# EAGLE design OpenEVSE_ESP32_LCD_v1.0.2 (EAGLE 9.6.2)
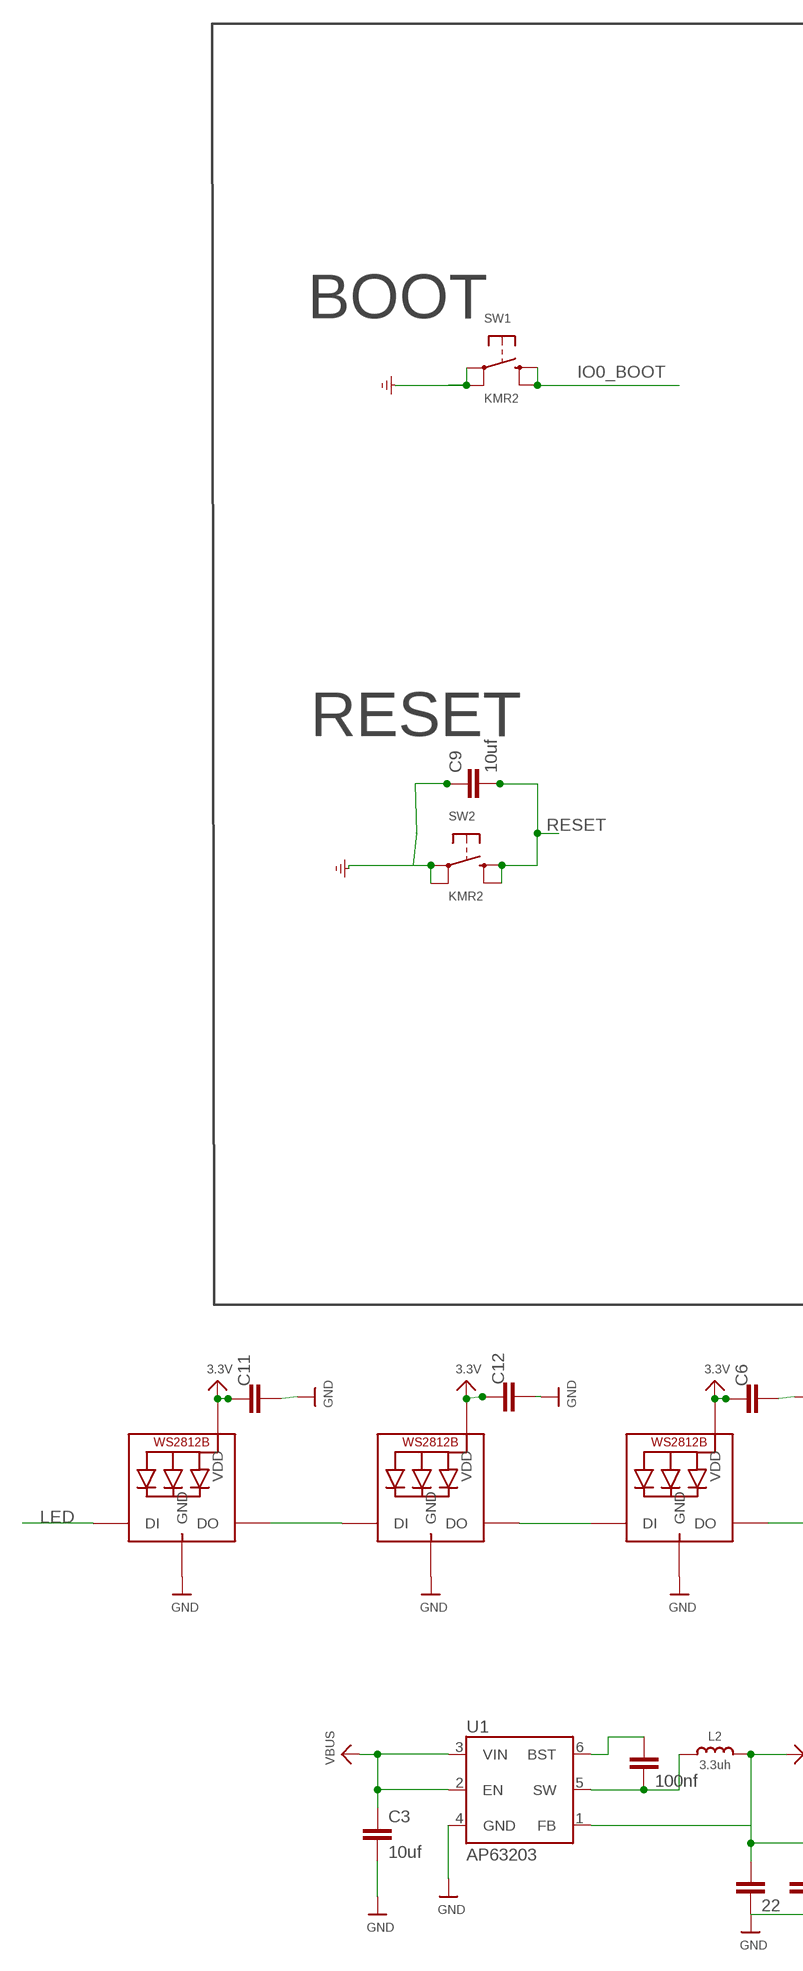
[diagram p0: schematic, sheet 1, part 1 of 2]
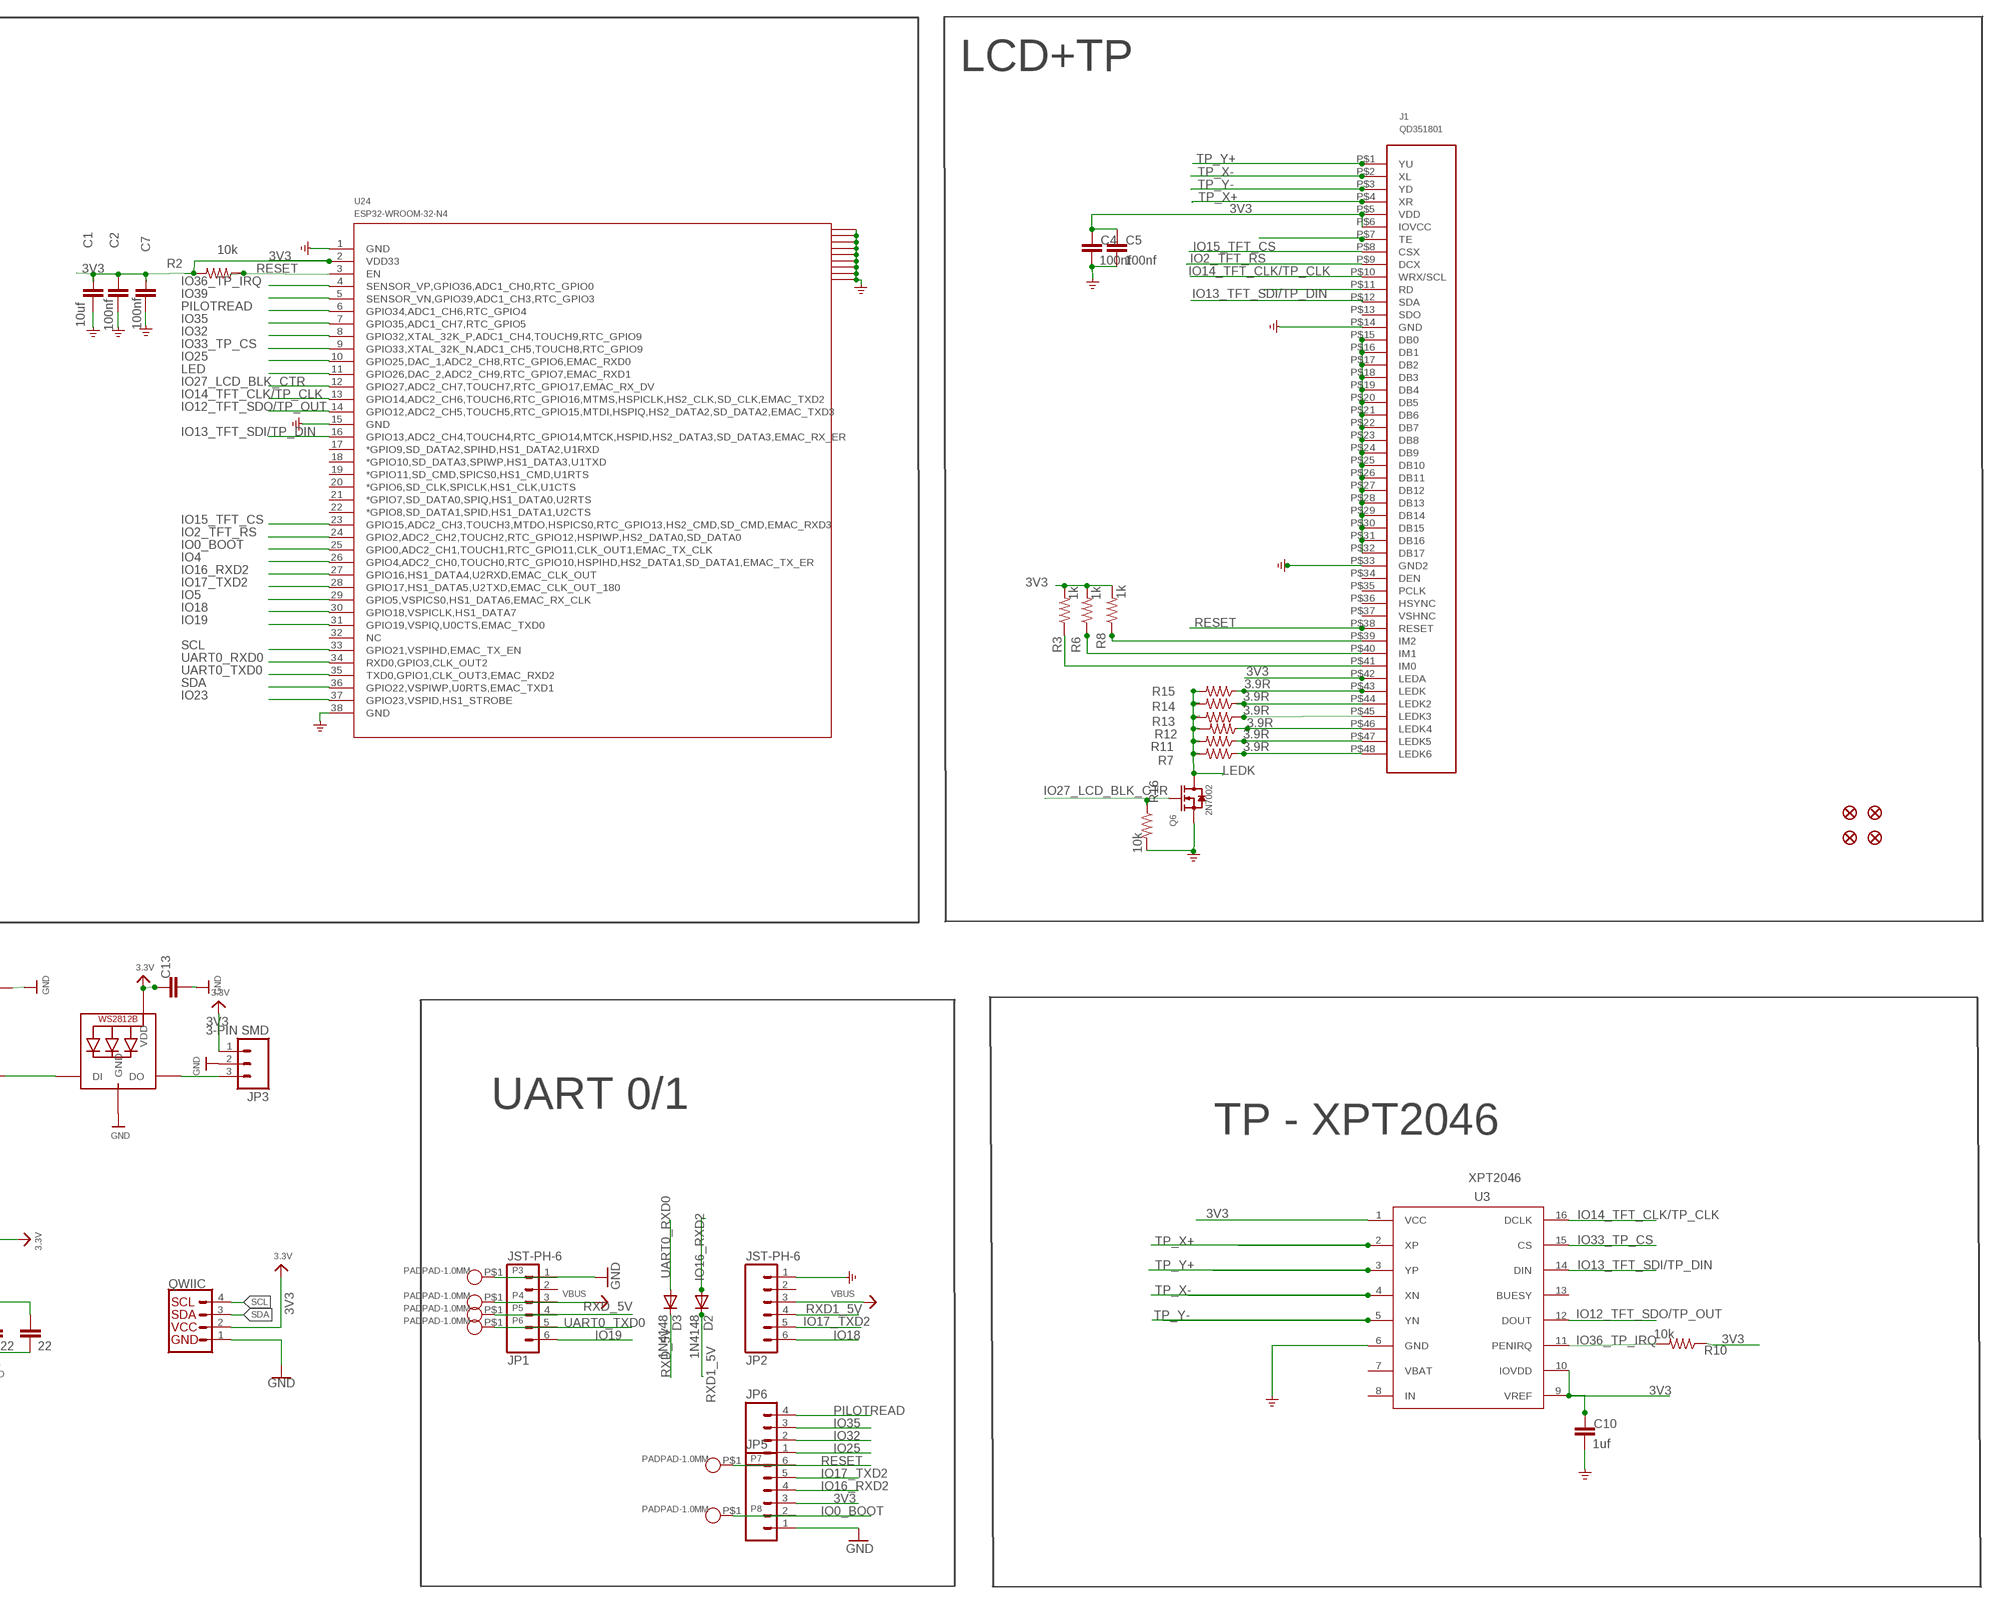
[diagram p1: schematic, sheet 1, part 2 of 2]

## Parts
C1  10uf  CAP0805  [0805]
C2  100nf  CAP0805  [0805]
C3  10uf  1.0UF-0805-25V-(+80/-20%)  [0805]
C4  100nf  CAP0805  [0805]
C5  100nf  CAP0805  [0805]
C6  CAP0805  [0805]
C7  100nf  CAP0805  [0805]
C8  22  1.0UF-0805-25V-(+80/-20%)  [0805]
C9  10uf  CAP0805  [0805]
C10  1uf  CAP0805  [0805]
C11  CAP0805  [0805]
C12  CAP0805  [0805]
C13  CAP0805  [0805]
C14  100nf  1.0UF-0805-25V-(+80/-20%)  [0805]
C15  22  1.0UF-0805-25V-(+80/-20%)  [0805]
D2  1N4148  DIODE-SOD123  [SOD123]
D3  1N4148  DIODE-SOD123  [SOD123]
FID1  FIDUCIAL1X2.5  [FIDUCIAL-1X2.5]
FID2  FIDUCIAL1X2.5  [FIDUCIAL-1X2.5]
FID3  FIDUCIAL1X2.5  [FIDUCIAL-1X2.5]
FID4  FIDUCIAL1X2.5  [FIDUCIAL-1X2.5]
J1  QD351801  [QD351801-0.8MM*48]
JP1  JST-PH-6  [JST-PH-6]
JP2  JST-PH-6  [JST-PH-6]
JP3  3-PIN SMD  M03JST-SMD  [JST-3-SMD]
JP5  M06SMD  [1X06-SMD]
JP6  M04SMD  [1X04-SMD]
L2  3.3uh  MICROBUILDER_INDUCTORNR5040  [MICROBUILDER_INDUCTOR_5X5MM_NR5040_NOTHERMALS]
LED1  WS2812B3535  [LED3535]
LED2  WS2812B3535  [LED3535]
LED3  WS2812B3535  [LED3535]
LED4  WS2812B3535  [LED3535]
P3  PADPAD-1.0MM  [PAD-1.0MM]
P4  PADPAD-1.0MM  [PAD-1.0MM]
P5  PADPAD-1.0MM  [PAD-1.0MM]
P6  PADPAD-1.0MM  [PAD-1.0MM]
P7  PADPAD-1.0MM  [PAD-1.0MM]
P8  PADPAD-1.0MM  [PAD-1.0MM]
Q6  2N7002  MOSFET-N'SOT23'  [SOT23]
QWIIC  QWIIC_CONNECTORJS-1MM  [JST04_1MM_RA]
R2  10k  RESISTOR0805  [0805]
R3  1k  RESISTOR0805  [0805]
R6  1k  RESISTOR0805  [0805]
R7  3.9R  RESISTOR0805  [0805]
R8  1k  RESISTOR0805  [0805]
R10  10k  RESISTOR0805  [0805]
R11  3.9R  RESISTOR0805  [0805]
R12  3.9R  RESISTOR0805  [0805]
R13  3.9R  RESISTOR0805  [0805]
R14  3.9R  RESISTOR0805  [0805]
R15  3.9R  RESISTOR0805  [0805]
R16  10k  RESISTOR0805  [0805]
SW1  KMR2  SWITCH_TACT_SMT4.6X2.8  [BTN_KMR2_4.6X2.8]
SW2  KMR2  SWITCH_TACT_SMT4.6X2.8  [BTN_KMR2_4.6X2.8]
U1  AP63203  [SOT23-6]
U3  XP2046  [XP2046-SSOP16]
U24  ESP32-WROOM-32-N4  [ESP32-WROOM-32-N4]

## Nets
3V3: C1.1 C2.1 C4.1 C5.1 C6.1 C7.1 C8.1 C10.1 C11.1 C12.1 C13.1 C15.1 J1.P$5(VDD) J1.P$6(IOVCC) J1.P$42(LEDA) JP3.1 JP5.3 L2.P$2 LED1.2(VDD) LED2.2(VDD) LED3.2(VDD) LED4.2(VDD) QWIIC.2 R2.2 R3.2 R6.2 R8.2 R10.1 U1.1(FB) U3.1(VCC) U3.9(VREF) U3.10(IOVDD) U24.2(VDD33) ; supply symbol labelled 3.3V
GND: C1.2 C2.2 C3.2 C4.2 C5.2 C6.2 C7.2 C8.2 C9.1 C10.2 C11.2 C12.2 C13.2 C15.2 J1.P$14(GND) J1.P$33(GND2) JP1.1 JP2.1 JP3.2 JP5.1 LED1.4(GND) LED2.4(GND) LED3.4(GND) LED4.4(GND) P3.P$1 Q6.2(S) QWIIC.1 R16.2 SW1.A'(P1) SW1.A(P) SW2.A'(P1) SW2.A(P) U1.4(GND) U3.6(GND) U24.1(GND) U24.15(GND) U24.38(GND) U24.41(GND) U24.42(GND) U24.43(GND) U24.44(GND) U24.45(GND) U24.46(GND) U24.47(GND) U24.48(GND) U24.49(GND)
IO0_BOOT: JP5.2 P8.P$1 SW1.B'(S1) SW1.B(S) U24.25(GPIO0,ADC2_CH1,TOUCH1,RTC_GPIO11,CLK_OUT1,EMAC_TX_CLK)
IO2_TFT_RS: J1.P$9(DCX) U24.24(GPIO2,ADC2_CH2,TOUCH2,RTC_GPIO12,HSPIWP,HS2_DATA0,SD_DATA0)
IO4: U24.26(GPIO4,ADC2_CH0,TOUCH0,RTC_GPIO10,HSPIHD,HS2_DATA1,SD_DATA1,EMAC_TX_ER)
IO5: U24.29(GPIO5,VSPICS0,HS1_DATA6,EMAC_RX_CLK)
IO12_TFT_SDO/TP_OUT: U3.12(DOUT) U24.14(GPIO12,ADC2_CH5,TOUCH5,RTC_GPIO15,MTDI,HSPIQ,HS2_DATA2,SD_DATA2,EMAC_TXD3)
IO13_TFT_SDI/TP_DIN: J1.P$12(SDA) U3.14(DIN) U24.16(GPIO13,ADC2_CH4,TOUCH4,RTC_GPIO14,MTCK,HSPID,HS2_DATA3,SD_DATA3,EMAC_RX_ER)
IO14_TFT_CLK/TP_CLK: J1.P$10(WRX/SCL) U3.16(DCLK) U24.13(GPIO14,ADC2_CH6,TOUCH6,RTC_GPIO16,MTMS,HSPICLK,HS2_CLK,SD_CLK,EMAC_TXD2)
IO15_TFT_CS: J1.P$8(CSX) U24.23(GPIO15,ADC2_CH3,TOUCH3,MTDO,HSPICS0,RTC_GPIO13,HS2_CMD,SD_CMD,EMAC_RXD3)
IO16_RXD2: D2.A JP5.4 U24.27(GPIO16,HS1_DATA4,U2RXD,EMAC_CLK_OUT)
IO17_TXD2: JP2.5 JP5.5 U24.28(GPIO17,HS1_DATA5,U2TXD,EMAC_CLK_OUT_180)
IO18: JP2.6 U24.30(GPIO18,VSPICLK,HS1_DATA7)
IO19: JP1.6 U24.31(GPIO19,VSPIQ,U0CTS,EMAC_TXD0)
IO23: U24.37(GPIO23,VSPID,HS1_STROBE)
IO25: JP6.1 U24.10(GPIO25,DAC_1,ADC2_CH8,RTC_GPIO6,EMAC_RXD0)
IO27_LCD_BLK_CTR: Q6.1(G) R16.1 U24.12(GPIO27,ADC2_CH7,TOUCH7,RTC_GPIO17,EMAC_RX_DV)
IO32: JP6.2 U24.8(GPIO32,XTAL_32K_P,ADC1_CH4,TOUCH9,RTC_GPIO9)
IO33_TP_CS: U3.15(CS) U24.9(GPIO33,XTAL_32K_N,ADC1_CH5,TOUCH8,RTC_GPIO9)
IO35: JP6.3 U24.7(GPIO35,ADC1_CH7,RTC_GPIO5)
IO36_TP_IRQ: R10.2 U3.11(PENIRQ) U24.4(SENSOR_VP,GPIO36,ADC1_CH0,RTC_GPIO0)
IO39: U24.5(SENSOR_VN,GPIO39,ADC1_CH3,RTC_GPIO3)
LED: LED1.1(DI) U24.11(GPIO26,DAC_2,ADC2_CH9,RTC_GPIO7,EMAC_RXD1)
LEDK: Q6.3(D) R7.2 R11.2 R12.2 R13.2 R14.2 R15.2
N$2: LED1.3(DO) LED2.1(DI)
N$5: J1.P$15(DB0) J1.P$16(DB1) J1.P$17(DB2) J1.P$18(DB3) J1.P$19(DB4) J1.P$20(DB5) J1.P$21(DB6) J1.P$22(DB7) J1.P$23(DB8) J1.P$24(DB9) J1.P$25(DB10) J1.P$26(DB11) J1.P$27(DB12) J1.P$28(DB13) J1.P$29(DB14) J1.P$30(DB15) J1.P$31(DB16) J1.P$32(DB17)
N$6: LED3.3(DO) LED4.1(DI)
N$7: C14.2 L2.P$1 U1.5(SW)
N$8: J1.P$44(LEDK2) R14.1
N$9: J1.P$11(RD)
N$11: LED2.3(DO) LED3.1(DI)
N$12: J1.P$43(LEDK) R15.1
N$13: JP3.3 LED4.3(DO)
N$14: J1.P$39(IM2) R8.1
N$16: J1.P$40(IM1) R6.1
N$17: J1.P$41(IM0) R3.1
N$18: J1.P$7(TE)
N$21: C14.1 U1.6(BST)
N$32: J1.P$45(LEDK3) R13.1
N$33: J1.P$46(LEDK4) R12.1
N$34: J1.P$47(LEDK5) R11.1
N$35: J1.P$48(LEDK6) R7.1
PILOTREAD: JP6.4 U24.6(GPIO34,ADC1_CH6,RTC_GPIO4)
RESET: C9.2 J1.P$38(RESET) JP5.6 P7.P$1 R2.1 SW2.B'(S1) SW2.B(S) U24.3(EN)
RXD1_5V: D2.C JP2.4
RXD_5V: D3.C JP1.4 P5.P$1
SCL: QWIIC.4 U24.33(GPIO21,VSPIHD,EMAC_TX_EN)
SDA: QWIIC.3 U24.36(GPIO22,VSPIWP,U0RTS,EMAC_TXD1)
TP_X+: J1.P$4(XR) U3.2(XP)
TP_X-: J1.P$2(XL) U3.4(XN)
TP_Y+: J1.P$1(YU) U3.3(YP)
TP_Y-: J1.P$3(YD) U3.5(YN)
UART0_RXD0: D3.A U24.34(RXD0,GPIO3,CLK_OUT2)
UART0_TXD0: JP1.5 P6.P$1 U24.35(TXD0,GPIO1,CLK_OUT3,EMAC_RXD2)
VBUS: C3.1 JP1.3 JP2.3 P4.P$1 U1.2(EN) U1.3(VIN)
Unconnected: J1.P$13(SDO) J1.P$34(DEN) J1.P$35(PCLK) J1.P$36(HSYNC) J1.P$37(VSHNC) JP1.2 JP2.2 U3.7(VBAT) U3.8(IN) U3.13(BUESY) U24.17(*GPIO9,SD_DATA2,SPIHD,HS1_DATA2,U1RXD) U24.18(*GPIO10,SD_DATA3,SPIWP,HS1_DATA3,U1TXD) U24.19(*GPIO11,SD_CMD,SPICS0,HS1_CMD,U1RTS) U24.20(*GPIO6,SD_CLK,SPICLK,HS1_CLK,U1CTS) U24.21(*GPIO7,SD_DATA0,SPIQ,HS1_DATA0,U2RTS) U24.22(*GPIO8,SD_DATA1,SPID,HS1_DATA1,U2CTS) U24.32(NC)

## Notes on the sheet
- LCD+TP
- BOOT
- RESET
- UART 0/1
- TP - XPT2046

## Library data of the parts
C1 C2 C4-C7 C9-C13 = SparkFun-Passives:CAP: Capacitor Standard 0603 ceramic capacitor, and 0.1" leaded capacitor.
C3 C8 C14 C15 = SparkFun-Capacitors:1.0UF: 1µF ceramic capacitors A capacitor is a passive two-terminal electrical component used to store electrical energy temporarily in an electric field.; PROD_ID: CAP-11625; VALUE: 1.0uF
D2 D3 = diode:DIODE-: DIODE
FID1-FID4 = SparkFun-Retired:FIDUCIAL: Fiducial Alignment Points Various fiducial points for machine vision alignment.
J1 = cooper:QD351801
JP1 JP2 = OpenEVSE:JST-PH-6
JP3 = SparkFun-Connectors:M03: Header 3 Standard 3-pin 0.1" header. Use with straight break away headers (SKU : PRT-00116), right angle break away headers (PRT-00553), swiss pins (PRT-00743), machine pins (PRT-00117), and female headers (PRT-00115). Molex polarized connector foot print use with SKU : PRT-08232 with associated crimp pins and housings.; PROD_ID: CONN-12591
JP5 = SparkFun:M06: Header 6 Standard 6-pin 0.1" header. Use with straight break away headers (SKU : PRT-00116), right angle break away headers (PRT-00553), swiss pins (PRT-00743), machine pins (PRT-00117), and female headers (PRT-00115). Molex polarized connector foot print use with SKU : PRT-08094 with associated crimp pins and housings. NOTES ON THE VARIANTS LOCK and LOCK_LONGPADS... This footprint was designed to help hold the alignment of a through-hole component (i.e. 6-pin header) while soldering it into place. You may notice that each hole has been shifted either up or down by 0.005 of an inch from it's more standard position (which is a perfectly straight line). This slight alteration caused the pins (the squares in the middle) to touch the edges of the holes. Because they are alternating, it causes a "brace" to hold the component in place. 0.005 has proven to be the perfect amount of "off-center" position when using our standard breakaway headers. Although looks a little odd when you look at the bare footprint, once you have a header in there, the alteration is very hard to notice. Also, if you push a header all the way into place, it is covered up entirely on the bottom side. This idea of altering the position of holes to aid alignment will be further integrated into the Sparkfun Library for other footprints. It can help hold any component with 3 or more connection pins.
JP6 = SparkFun:M04: Header 4 Standard 4-pin 0.1" header. Use with straight break away headers (SKU : PRT-00116), right angle break away headers (PRT-00553), swiss pins (PRT-00743), machine pins (PRT-00117), and female headers (PRT-00115). Molex polarized connector foot print use with SKU : PRT-08231 with associated crimp pins and housings. 1MM SMD Version SKU: PRT-10208
L2 = ESP32_v1_SMPS:MICROBUILDER_INDUCTOR: Inductors 0603: 10nH Ceramic Inductor - microwire antenna/RF (Digikey: 712-1434-2-ND) 0805: 560nH Ceramic Inductor - RF (Digikey: 553-1047-1-ND) 270nH Ceramic Inductor - Q = 40@250MHz, +-5%, 1 Ohm DC Resistance (Digikey: 535-10506-2-ND) 1007 (2518 Metric) SMT: 10µH 10% 250mOhm 820mA 1007 Inductor (Digikey: 587-2189-1-ND) 22µH 10% 500mOhm 580mA 1007 Inductor (Digikey: 587-2190-1-ND) 47µH 10% 950mOhm 420mA 1007 Inductor (Digikey: 587-2191-1-ND) 47µH 5% 100mOhm 1A 1008 Inductor (Digikey: 732-1816-1-ND) 5.0x5.0mm (Taiyo Yuden NR5040 Series) 6.8µH 20% 2.3A 64mOhm Inductor (Digikey: 587-2374-2-ND) 5.0x5.0mm (TDK VLC5045 Series) 4.7µH 20% 3.3A 34mOhm Inductor (Digikey: 445-6526-1-ND) 6.8µH 20% 2.7A 46mOhm Inductor (Digikey: 445-6527-1-ND) 6.0x6.0mm (TDK VLC6045 Series) 4.7µH 20% 3.8A 27mOhm Inductor (Digikey: 445-6538-2-ND) 6.8µH 20% 3A 41mOhm Inductor (Digikey: 445-6540-1-ND) 6.2µH 30% 2.2A 45mOhm Inductor (Digikey: SRR5028-6R2YCT-ND) - Not TDK VLC6045 but footprint should match 6.0x6.0mm (TDK SLF6045 Series) 6.8uH 30% 2A 33mOhm Inductor (Digikey: 445-4572-1-ND, Mouser: 810-SLF645T6R8N2R0PF) 6.0x6.0mm (Sumida CDRH5D28 Series) 6.2uH 30% 1.8A 45mOhm Inductor (Digikey: 308-1542-1-ND) Taiyo Yuden NR3015T2R2M - 2.2uH 20% 1.5A (Digikey: 587-1648-2-ND, Mouser: 963-NR3015T2R2M) - Used with TI TPS62172 CoilCraft RFID Transponder Coil - MA5532-AE (For use with AS3935 Lightning Sensor)
LED1-LED4 = adafruit:WS2812B
P3-P8 = crowpi_pow:PAD*
Q6 = discrete:MOSFET-N: IRLL014: http://www.vishay.com/docs/91319/sihll014.pdf
QWIIC = SparkFun-Connectors:QWIIC_CONNECTOR: SparkFun I2C Standard Qwiic Connector An SMD 1mm pitch JST connector makes it easy and quick (get it? Qwiic?) to connect I2C devices to each other. The Qwiic system <http://www.sparkfun.com/qwiic> enables fast and solderless connection between popular platforms and various sensors and actuators. We carry 200mm <https://www.sparkfun.com/products/14204>, 100mm <https://www.sparkfun.com/products/14205>, 50mm <https://www.sparkfun.com/products/14206>, and breadboard friendly <https://www.sparkfun.com/products/14207> Qwiic cables. We also offer 10 pcs strips <https://www.sparkfun.com/products/14323> the SMD connectors.; PROD_ID: CONN-13694
R2 R3 R6-R8 R10-R16 = SparkFun-Resistors:RESISTOR: Generic Resistor Package
SW1 SW2 = microbuilder:SWITCH_TACT_SMT: SMT Tact Switches 6x6mm - Digikey: P12940SCT-ND KMR2 (4.6x2.8mm) - Digikey: 401-1426-1-ND EVQ-PQHB55 - Light Touch, 160GF (4.5x4.5mm) - Digikey: P8090SCT-ND KMT0 - KMT021 NGJ LHS (etc.) IP68/Waterproof - Digikey: CKN10289CT-ND
U1 = SparkFun-IC-Power:AP63203: Diodes Inc. AP63203 3.8V-32V input 3.3V Buck The AP63200/AP63201/AP63203/AP63205 is a 2A, synchronous buck converter with a wide input voltage range of 3.8V to 32V and fully integrates a 125mΩ high-side power MOSFET and a 68mΩ lowside power MOSFET to provide high-efficiency step-down DC/DC conversion; PROD_ID: VREG-15244
U3 = cooper:XP2046; XPT2046: XPT2046
U24 = cooper:ESP32-WROOM-32-N4

## Net classes
0 default: width 0.152 mm, drill 0.3 mm, clearance 0.152 mm

## Board
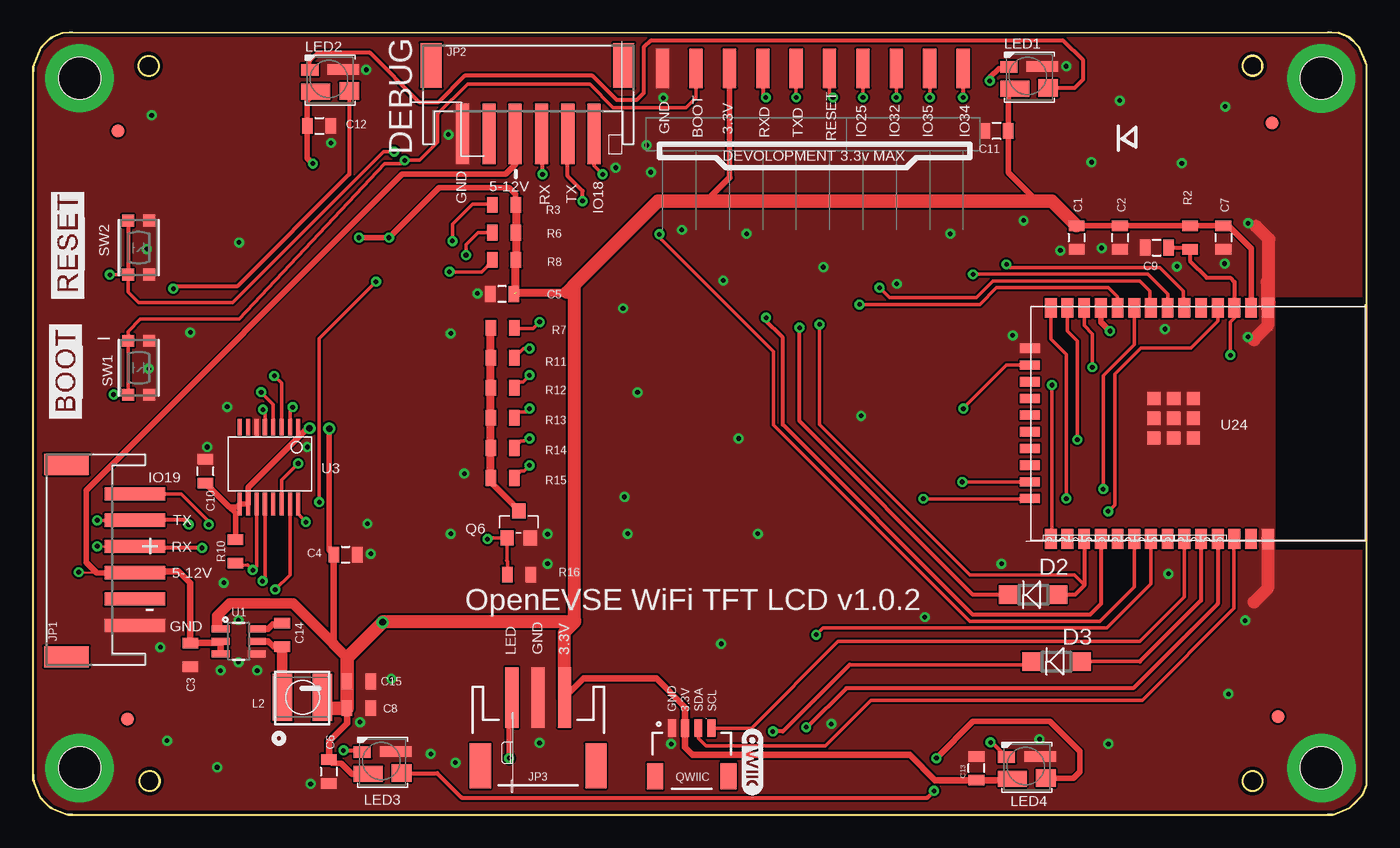
[diagram p2: board, top side]
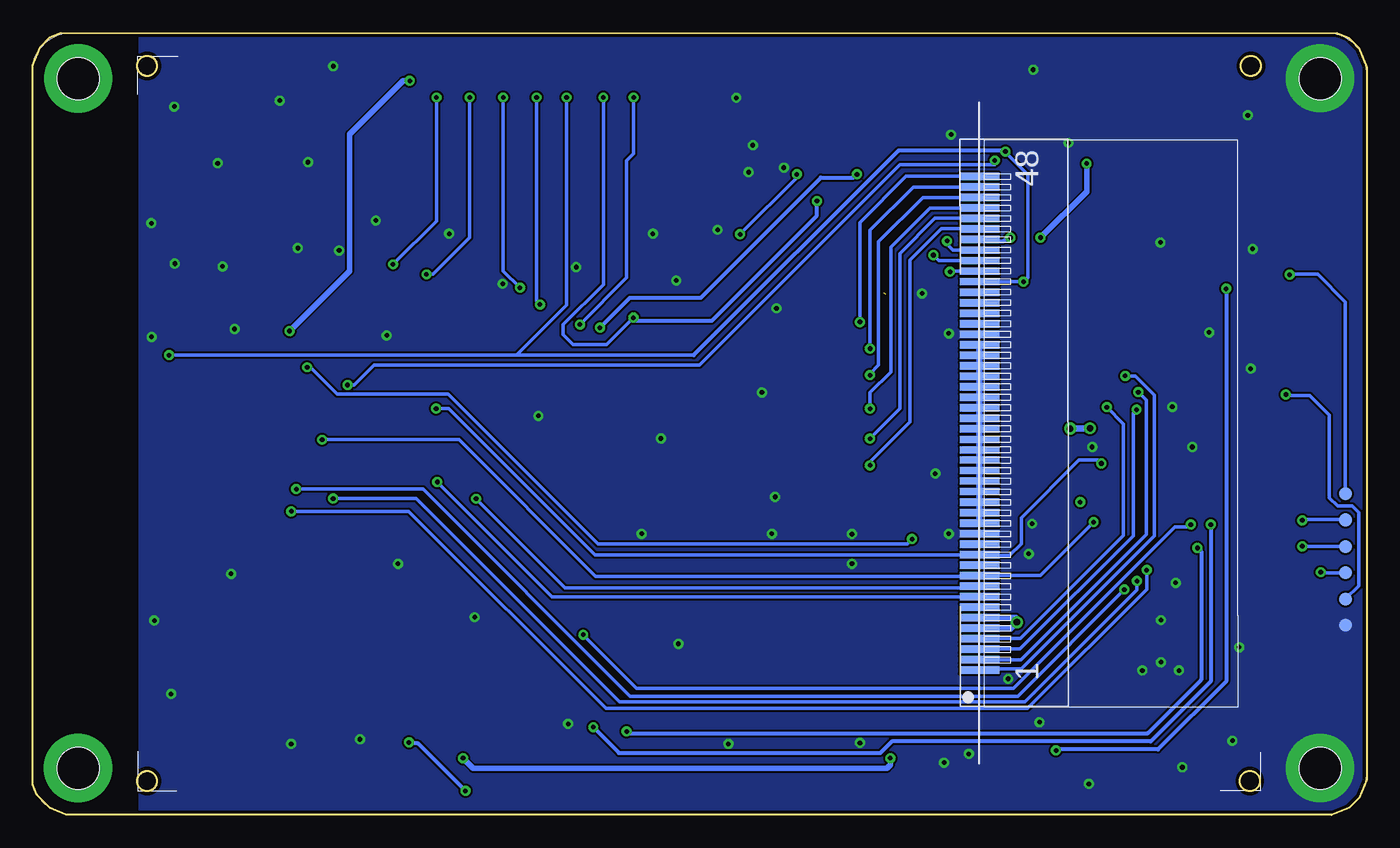
[diagram p3: board, bottom side, seen from below]

Size 101.5 x 59.52 mm. Coordinates in mm from the lower left corner, seen from the top.
Outline: 101.5,2.28 101.5,57.07 100.93,58.44 100.2,59.17 99.35,59.52 2.24,59.5 1.36,59.14 0.6,58.38 0,56.92 0,2.67 0.57,1.29 1.3,0.56 2.66,0 98.95,0.02 100.19,0.54 101.19,1.53 101.5,2.28
Outline: circle at 92.81,2.57 radius 0.75
Outline: circle at 92.81,57.01 radius 0.75
Outline: circle at 8.81,57.01 radius 0.75
Outline: circle at 8.89,2.57 radius 0.75
Copper layers (1*16): Top 0.035mm / dielectric 1.5mm / Bottom 0.035mm
Design rules "default *": minimum track width 6mil, minimum drill 0.35mm, track to track 6mil, track to pad 5mil, pad to pad 5mil, via to via 6mil, smd to smd 6mil, copper to edge 10mil, drill to drill 10mil, minimum pad ring 10mil, minimum via ring 8mil, stop-mask expansion 4mil, vias tented up to drill 100mil, thermal gap 0mil
tRestrict: area 19,72.9 to 28.8,92
bRestrict: area 19,72.9 to 28.8,92

### Footprints (pad centres in the part's own frame; a part is rotated, then mirrored left to right if it is on the bottom)
0805 = smd 0.8 x 1.2: 1 -0.9,0; 2 0.9,0
SOD123 = smd 1.4 x 1.4: A 1.9,0; C -1.9,0
FIDUCIAL-1X2.5 = smd 1 x 1: 1 0,0
QD351801-0.8MM*48 = smd 0.55 x 3: P$1 0,0.508; P$2 0.8,0.508; P$3 1.6,0.508; P$4 2.4,0.508; P$5 3.2,0.508; P$6 4,0.508; P$7 4.8,0.508; P$8 5.588,0.508; P$9 6.388,0.508; P$10 7.188,0.508; P$11 7.988,0.508; P$12 8.788,0.508; P$13 9.588,0.508; P$14 10.388,0.508; P$15 11.188,0.508; P$16 11.988,0.508; P$17 12.788,0.508; P$18 13.589,0.508; P$19 14.389,0.508; P$20 15.189,0.508; P$21 15.989,0.508; P$22 16.764,0.508; P$23 17.564,0.508; P$24 18.364,0.508; P$25 19.164,0.508; P$26 19.964,0.508; P$27 20.764,0.508; P$28 21.564,0.508; P$29 22.364,0.508; P$30 23.164,0.508; P$31 23.964,0.508; P$32 24.764,0.508; P$33 25.564,0.508; P$34 26.364,0.508; P$35 27.164,0.508; P$36 27.964,0.508; P$37 28.764,0.508; P$38 29.564,0.508; P$39 30.364,0.508; P$40 31.164,0.508; P$41 31.98,0.498; P$42 32.78,0.498; P$43 33.58,0.498; P$44 34.38,0.498; P$45 35.18,0.498; P$46 35.98,0.498; P$47 36.78,0.498; P$48 37.58,0.498
JST-PH-6 = smd 1 x 4.6: 1 -5,-4.74; 2 -3,-4.74; 3 -1,-4.74; 4 1,-4.74; 5 3,-4.74; 6 5,-4.74 | smd 1.6 x 3.4: NC1 -7.4,0.46; NC2 7.25,0.46
JST-3-SMD = smd 1 x 4.6: 1 -1.99,-4.77; 2 0.01,-4.77; 3 2.01,-4.77 | smd 1.6 x 3.4: NC1 -4.39,0.43; NC2 4.41,0.43
1X06-SMD = smd 1 x 3: 1 -6.35,5; 2 -3.81,5; 3 -1.27,5; 4 1.27,5; 5 3.81,5; 6 6.35,5
1X04-SMD = smd 1 x 3: 1 -3.81,5; 2 -1.27,5; 3 1.27,5; 4 3.81,5
MICROBUILDER_INDUCTOR_5X5MM_NR5040_NOTHERMALS = smd 1.5 x 3.6: P$1 -1.55,0; P$2 1.5,0
LED3535 = smd 1.3 x 0.9: 1 -1.55,0.775 | smd 2.2 x 1.2: 2 -1.1,-0.875 | smd 1.5 x 1.3: 3 1.45,-0.825 | smd 2.4 x 0.8: 4 1,0.825
PAD-1.0MM = smd 1 x 1: P$1 0,0
SOT23 = smd 1.016 x 1.143: 1 -0.889,-1.016; 2 0.889,-1.016; 3 0,1.016
JST04_1MM_RA = smd 0.6 x 1.35: 1 -1.5,0; 2 -0.5,0; 3 0.5,0; 4 1.5,0 | smd 1.2 x 2: NC1 2.8,-3.675; NC2 -2.8,-3.675
BTN_KMR2_4.6X2.8 = smd 0.9 x 0.9: A 2.05,0.8; A' -2.05,0.8; B 2.05,-0.8; B' -2.05,-0.8
SOT23-6 = smd 0.55 x 1.35: 1 -0.95,-1.375; 2 0,-1.375; 3 0.95,-1.375; 4 0.95,1.375; 5 0,1.375; 6 -0.95,1.375
XP2046-SSOP16 = smd 0.305 x 1.27: 1 -2.54,-2.54; 2 -1.905,-2.54; 3 -1.27,-2.54; 4 -0.635,-2.54; 5 0,-2.54; 6 0.635,-2.54; 7 1.27,-2.54; 8 1.905,-2.54 | smd 0.305 x 1.778: 9 1.905,3.302; 10 1.27,3.302; 11 0.635,3.302; 12 0,3.302; 13 -0.635,3.302; 14 -1.27,3.302; 15 -1.905,3.302; 16 -2.54,3.302
ESP32-WROOM-32-N4 = smd 1.5 x 0.9: 1 -8.898,6.761; 2 -8.898,5.491; 3 -8.898,4.221; 4 -8.898,2.951; 5 -8.898,1.681; 6 -8.898,0.411; 7 -8.898,-0.859; 8 -8.898,-2.129; 9 -8.898,-3.399; 10 -8.898,-4.669; 11 -8.898,-5.939; 12 -8.898,-7.209; 13 -8.898,-8.479; 14 -8.898,-9.749; 25 8.702,-9.749; 26 8.702,-8.479; 27 8.702,-7.209; 28 8.702,-5.939; 29 8.702,-4.669; 30 8.702,-3.399; 31 8.702,-2.129; 32 8.702,-0.859; 33 8.702,0.411; 34 8.702,1.681; 35 8.702,2.951; 36 8.702,4.221; 37 8.702,5.491; 38 8.702,6.761 | smd 0.7 x 1.5: 15 -5.808,-11.349; 16 -4.538,-11.349; 17 -3.268,-11.349; 18 -1.998,-11.349; 19 -0.728,-11.349; 20 0.542,-11.349; 21 1.812,-11.349; 22 3.082,-11.349; 23 4.352,-11.349; 24 5.622,-11.349 | smd 1 x 1: 41 -0.484,-0.402; 42 1.016,-0.402; 43 -1.984,-0.402; 44 -1.984,-1.902; 45 -0.484,-1.902; 46 1.016,-1.902; 47 1.016,1.098; 48 -0.484,1.098; 49 -1.984,1.098

### Placement (x,y rotation side)
C1  79.42,43.94 270 top
C2  82.73,43.94 270 top
C3  11.99,12.19 270 top
C4  23.8,19.81 0 top
C5  35.71,39.65 180 top
C6  22.53,3.3 270 top
C7  90.6,43.94 270 top
C8  24.81,8.12 0 top
C9  85.52,43.18 0 top
C10  13.13,26.16 90 top
C11  73.33,52.07 180 top
C12  21.79,52.45 0 top
C13  71.8,3.55 90 top
C14  18.97,13.71 270 top
C15  24.81,10.16 0 top
D2  76.12,16.76 0 top
D3  77.9,11.68 0 top
FID1  6.48,52.08 0 top
FID2  94.76,7.49 0 top
FID3  7.21,7.31 0 top
FID4  94.31,52.68 0 top
J1  28.96,11.02 90 bottom
JP1  3.01,19.43 90 top
JP2  37.71,56.59 0 top
JP3  38.46,4.17 180 top
JP5  54.28,51.81 0 top
JP6  66.98,51.81 0 top
L2  20.54,8.95 0 top
LED1  75.82,56.16 0 top
LED2  22.63,55.93 0 top
LED3  26.62,4.01 0 top
LED4  75.64,3.63 0 top
P3  1.62,14.45 0 bottom
P4  1.62,18.44 0 bottom
P5  1.62,20.42 0 bottom
P6  1.62,22.45 0 bottom
P7  1.62,24.43 0 bottom
P8  1.62,16.43 0 bottom
Q6  36.97,22.11 0 top
QWIIC  50.14,6.61 0 top
R2  88.06,43.94 90 top
R3  35.86,46.43 0 top
R6  35.86,44.33 0 top
R7  35.74,37.08 180 top
R8  35.85,42.24 0 top
R10  15.42,20.06 270 top
R11  35.74,34.79 180 top
R12  35.74,32.51 180 top
R13  35.74,30.22 180 top
R14  35.74,27.94 180 top
R15  35.74,25.65 180 top
R16  37.01,18.28 0 top
SW1  8.05,34.03 270 top
SW2  8.05,43.18 270 top
U1  15.67,13.2 270 top
U3  17.66,26.97 180 top
U24  87.21,29.7 270 top
U$2  [3.5底板框]  -0.6,-0.62 0 top
U$44  [QWIIC_5MM]  54.77,4.06 270 top

### Tracks (layer width: path | path; a pad name or v marks a point on that pad's centre or on a via)
3V3  (via drill 0.35, 0.5)  (1 unrouted)
  Top 0.254: 74.09,46.48 74.34,46.73 | U3.1 20.2,28.73 20.14,28.67 | LED4.2 74.44,2.65 74.09,2.65 | 36.75,39.74 36.66,39.65 C5.1
  Top 0.305: LED1.2 74.48,55.04 74.23,55.04 | LED2.2 21.53,55.04 20.89,54.4 | LED3.2 25.47,3.08 25.25,3.08
  Top 0.406: U24.2 92.7,43.11 90.97,44.84 C7.1 R2.2 C2.1 C1.1 | v22.55,29.4 22.55,20.15 C4.1 | R3.2 36.75,47.24 36.24,47.75 30.91,47.75 v27.1,43.94 v24.81,43.94 | 74.23,55.04 C11.1 74.23,48.88 76.12,46.99 76.12,46.73 | v21.31,49.58 20.89,49.99 C12.1 20.89,54.4 21.35,54.76 21.35,55.07 | 25.5,3.08 25.25,3.08 24.31,3.08 23.45,3.94 22.78,3.94 C6.1 | JP5.3 53.01,48.51 | C10.1 14.94,23.45 | 14.94,23.45 15.42,22.97 R10.1 | v21.05,29.43 21,29.38 20.85,29.38 20.14,28.67 16.39,24.92 U3.10 U3.9 15.54,23.45 14.94,23.45
  Top 0.508: JP3.1 41.9,10.39 47.45,10.39 49.63,8.2 QWIIC.2 49.64,5.14 50.21,4.57 66.72,4.57 68.64,2.65 C13.1 74.09,2.65 | 53.01,48.51 51.23,46.73 | C4.1 22.9,13.01 22.9,12.98 | C8.1 23.91,6.97 22.53,5.58 C6.1 | U1.1 14.04,14.41
  Top 0.61: R3.2 R6.2 R8.2 36.75,39.74 | 36.77,39.76 40.62,39.76
  Top 0.813: 22.9,12.98 23.91,11.96 | 14.04,14.41 14.04,15.16 14.98,16.1 19.81,16.1 22.9,13.01
  Top 1: 40.62,39.76 41.15,40.29 | JP3.1 40.45,13.89 41.26,14.69 41.1,14.69 | v26.62,14.67 26.64,14.69 41.1,14.69 | 41.1,14.69 41.23,14.81 41.23,40.37
  Top 1.016: C1.1 77.53,46.73 76.12,46.73 74.34,46.73 51.23,46.73 47.59,46.73 41.23,40.37 41.15,40.29 | L2.P$2 22.04,8.36 22.27,8.12 C8.1 C15.1 23.91,11.96 v26.62,14.67
  Bottom 0.305: 27.35,43.94 27.61,43.68 29.34,43.68 J1.P$42
  Bottom 0.406: v27.1,43.94 27.35,43.94 | v24.81,43.94 21.31,47.44 v21.31,49.58
  Bottom 0.5: J1.P$6 29.44,14.99 26.69,14.99 26.62,14.92 v26.62,14.67 27.07,14.21 J1.P$5 | v22.55,29.4 22.55,29.39 21.09,29.39 v21.05,29.43
GND  (via drill 0.35, 3.2 pad 5.2)
  Top 1: 92.91,36.18 93.97,37.24 U24.1 | U24.1 93.97,40.53 93.93,40.58 | U24.38 93.97,17.25 92.91,16.19 | U24.1 93.97,38.93 94.06,39.02 94.06,43.83 93.08,44.81
  other vias: 46.7,50.98 44.91,38.56 15.69,43.57 8.83,33.96 53.71,28.65 49.39,44.53 3.56,3.56 3.56,56.08 74.56,36.5 78.19,42.96 90.7,41.96 92.47,36.38 81.33,43.14 87.06,41.74 25.45,22.16 13.26,28.01 45.01,24.2 33.84,39.69 14.79,31.05 9.04,53.24 44.35,49.26 92.48,45.03 39.17,21.38 39.17,19.12 31.8,36.64 48.57,5.4 32.16,3.98 92.26,14.8 98.06,3.58 98.04,56.06 14.28,10.99 14.02,3.62 9.71,12.77 31.63,51.78 22.69,51.15 17.07,10.99 20.88,28.01 38.56,5.48 25.71,19.88 31.8,21.4 11.98,36.73 8.68,43.08 47.03,48.92 47.97,54.58 86.15,36.98 63.03,30.38 46.02,32.16 80.56,49.68 32.82,25.97 45.27,21.4 55.17,21.4 73.71,19.12 90.73,53.91 78.64,56.99 87.43,49.6 90.99,9.21 81.84,5.4 52.38,13.02 67.87,15.05 86.41,18.35 30.28,4.64 10.21,5.65 60.76,6.92 25.37,56.72 21.14,2.35 76.61,5.76 75.4,45.25 69.81,44.23 65.74,40.42 60.16,41.69 52.54,40.68 54.31,44.23 24.89,7.05 27.28,10.35 15.65,11.62 15.65,14.82 14.53,17.67 82.71,54.37
  pour Bottom: -0.23,59.83 93.42,59.83 93.42,-1 -0.23,-1
  pour Top: -1.52,60.95 99.87,60.95 102.3,58.52 102.3,39.45 94.57,39.45 94.49,39.37 94.49,20.13 102.22,20.13 102.3,20.05 102.3,-2.63 102.05,-2.89 -1.52,-2.89
IO0_BOOT  (via drill 0.35)
  Top 0.254: U24.25 77.56,21.09 v77.56,32.72 | JP5.2 50.47,54.61 49.71,53.84 44.17,53.84 42.39,55.62 33.07,55.62 30.81,53.36 30.81,51.2 29.42,49.82 v28.29,49.82 28.04,49.56 26.76,49.56 15.71,37.73 8.19,37.73 7.25,36.79 SW1.B' SW1.B 7.23,32 v6.14,32
  Bottom 0.254: v77.56,32.72 77.05,32.72 75.53,34.24 50.77,34.24 35.53,49.48 28.29,49.48 v28.29,49.82 | P8.P$1 0.61,17.45 0.61,23.01 1.11,23.51 2.21,23.51 2.83,24.13 2.83,30.44 4.32,31.92 6.14,31.92 v6.14,32
IO2_TFT_RS  (via drill 0.35)
  Top 0.254: U24.24 75.65,24.08 75.64,24.07 v67.77,24.07
  Bottom 0.254: v67.77,24.07 60.99,17.29 29.58,17.29 J1.P$9
IO12_TFT_SDO/TP_OUT  (via drill 0.35)
  Top 0.254: U3.12 17.66,17.98 v17.48,17.8 | U24.14 77.46,36.21 78.65,35.03 v78.65,24.07
  Bottom 0.254: v78.65,24.07 72.34,24.07 56.87,8.6 26.01,8.6 24.14,10.47 17.48,17.12 v17.48,17.8
IO13_TFT_SDI/TP_DIN  (via drill 0.35)
  Top 0.254: U3.14 18.92,23.68 18.92,25.22 | v20.19,26.75 18.92,25.48 18.92,25.22 | 18.92,25.22 | U24.16 74.09,34.24 70.81,30.96 v70.81,30.92
  Bottom 0.254: v70.81,30.92 69.85,30.92 58.72,19.8 29.47,19.8 J1.P$12 29.41,19.75 27.18,19.75 26.29,20.64 26.29,22.62 21.9,27.01 20.45,27.01 v20.19,26.75
IO14_TFT_CLK/TP_CLK  (via drill 0.35)
  Top 0.254: U3.16 20.2,22.9 20.78,22.33 v20.78,22.29 | U24.13 78.73,36.82 79.49,36.07 v79.49,28.55
  Bottom 0.254: 28.9,18.22 24.84,18.22 v20.78,22.29 | J1.P$10 29.41,18.16 58.66,18.16 69.06,28.55 v79.49,28.55
  Bottom 0.305: J1.P$10 28.92,18.21 28.9,18.22
IO15_TFT_CS  (via drill 0.35)
  Top 0.254: U24.23 70.74,25.35 v70.73,25.34
  Bottom 0.254: v70.73,25.34 61.99,16.6 29.39,16.6
  Bottom 0.305: J1.P$8 29.39,16.6
IO16_RXD2  (via drill 0.35)
  Top 0.254: v59.87,37.33 59.87,29.71 71.3,18.28 79.24,18.28 80,17.52
  Top 0.305: U24.27 80,17.52 80,17.46 79.81,17.27 79.3,16.76 D2.A | JP5.4 55.55,54.61 v55.77,54.61
  Bottom 0.254: v55.77,54.61 55.77,50.32 56.31,49.78 56.31,40.89 v59.87,37.33
IO17_TXD2  (via drill 0.35)
  Top 0.254: v58.09,54.61 JP5.5
  Top 0.305: U24.28 81.27,16.07 80.44,15.24 71.55,15.24 57.07,29.71 57.07,36.32 55.67,37.72 v55.8,37.84 | v41.83,46.73 41.83,47.49 40.71,48.62 JP2.5
  Bottom 0.254: v55.8,37.84 57.83,35.81 60.37,35.81 61.14,36.57 61.14,37.33 58.09,40.38 v58.09,54.61
  Bottom 0.305: v55.8,37.84 55.57,37.61 49.83,37.61 41.83,45.61 v41.83,46.73
IO18  (via drill 0.35)
  Top 0.254: U24.30 83.81,17.34 81.2,14.73 71.3,14.73 56.36,29.66 56.36,35.25 47.67,43.94 v47.67,44.19 | v43.36,48.76 42.71,49.41 JP2.6
  Bottom 0.254: v47.67,44.19 43.36,48.51 v43.36,48.76
IO19  (via drill 0.35)
  Top 0.254: v59.61,13.71 60.12,14.22 81.71,14.22 85.08,17.59 U24.31 | JP1.6 11.3,24.43 13.38,22.35 v13.38,22.09
  Bottom 0.254: v13.38,22.09 13.55,21.93 14.61,21.93 26.9,9.65 55.55,9.65 v59.61,13.71
IO25  (via drill 0.35)
  Top 0.254: v62.91,38.86 72.06,38.86 73.33,40.13 81.85,40.13 82.54,39.43 U24.10 | v63.17,54.61 JP6.1
  Bottom 0.254: v62.91,38.86 63.17,39.11 v63.17,54.61
IO27_LCD_BLK_CTR  (via drill 0.35)
  Top 0.254: U24.12 80,37.23 80.62,36.61 v80.62,34.07 | v34.59,20.99 34.69,21.09 Q6.1 36.09,19.4 36.05,19.36 36.11,19.3 R16.1
  Bottom 0.254: v80.62,34.07 80.37,34.07 78.33,32.04 69.89,32.04 58.49,20.64 34.95,20.64 v34.59,20.99
IO32  (via drill 0.35)
  Top 0.254: JP6.2 v65.71,54.61 | v64.44,40.13 65.2,39.37 71.8,39.37 73.07,40.64 84.25,40.64 85.01,39.87 85.01,38.67 U24.8
  Bottom 0.254: v65.71,54.61 65.71,41.4 v64.44,40.13
IO33_TP_CS  (via drill 0.35)
  Top 0.254: v81.45,24.8 81.45,33.43 83.81,35.8 U24.9 | U3.15 19.56,18.27 v18.44,17.15
  Bottom 0.254: v18.44,17.15 26.55,9.04 56.04,9.04 71.8,24.8 v81.45,24.8
IO35  (via drill 0.35)
  Top 0.254: U24.7 86.35,39.65 84.86,41.14 v71.55,41.14 | v68.25,54.61 JP6.3
  Bottom 0.254: v71.55,41.14 71.04,41.14 68.25,43.94 v68.25,54.61
IO36_TP_IRQ  (via drill 0.35)
  Top 0.254: U24.4 90.16,37.58 88.13,35.55 84.32,35.55 82.34,33.57 82.34,23.61 v81.83,23.1 | v81.83,23.1 | U3.11 17.03,18.92 v16.74,18.63 16.35,19.01 15.64,18.93 R10.2
  Bottom 0.254: v81.83,23.1 72.9,23.1 57.89,8.09 25.8,8.09 16.74,17.16 v16.74,18.63
LED  (via drill 0.35)
  Top 0.305: LED1.1 74.15,56.81 73.5,56.81
  Top 0.406: 73.5,56.81 72.82,56.13 v72.82,55.88 | U24.11 81.27,37.52 v81.96,36.83
  Bottom 0.406: v81.96,36.83 77.39,41.4 77.39,51.81 73.33,55.88 v72.82,55.88
LEDK
  Top 0.5: Q6.3 36.97,23.19 34.84,25.33
  Top 0.61: 34.84,25.33 R15.2 R14.2 R13.2 R12.2 R11.2 R7.2
N$2
  Top 0.305: LED1.3 79.28,55.33 79.93,55.98 79.93,57.43 78.43,58.92 46.99,58.92 46.48,58.42 46.48,54.94 45.95,54.4 44.45,54.4 42.59,56.26 32.87,56.26 30.83,54.23 29.44,54.23 25.65,58.01 21.69,58.01 21.08,57.4 LED2.1
N$5
  Bottom 0.305: 29.5,35.75 29.5,35.08 29.46,35.05 | J1.P$31 29.46,34.03 | J1.P$30 29.46,33.27 | J1.P$29 29.46,32.51 | J1.P$28 29.46,31.75 | J1.P$27 J1.P$26 | J1.P$26 29.46,30.22 | J1.P$25 29.46,29.21 | J1.P$24 29.46,28.44 | J1.P$23 29.46,27.68 | J1.P$22 29.46,26.92 | J1.P$20 29.46,26.16 | J1.P$21 J1.P$20 | J1.P$20 J1.P$19 | J1.P$19 29.46,24.63 | J1.P$18 29.46,23.62 | J1.P$17 29.46,23.11 | J1.P$16 J1.P$15
  Bottom 0.5: 29.5,35.75 J1.P$32 29.46,35.05 29.46,34.03 29.46,33.27 29.46,32.51 29.46,31.75 J1.P$26 29.46,30.22 29.46,29.21 29.46,28.44 29.46,27.68 29.46,26.92 29.46,26.16 J1.P$19 29.46,24.63 29.46,23.62 29.46,23.11 J1.P$15
N$6  (via drill 0.35)
  Top 0.305: LED3.3 30.77,3.18 32.64,1.32 68.07,1.32 v68.58,1.83 | v72.87,5.51 72.98,5.51 LED4.1
  Bottom 0.305: v68.58,1.83 72.18,5.43 72.87,5.43 v72.87,5.51
N$7
  Top 0.508: U1.5 17.92,13.2 18.31,12.81 C14.2 18.99,12.79
  Top 0.813: 18.99,12.79 L2.P$1
N$8  (via drill 0.35)
  Top 0.254: v37.79,28.64 37.79,28.84 37.4,28.44 37.14,28.44 R14.1
  Bottom 0.254: J1.P$44 29.46,45.41 32.84,45.41 35.51,42.74 35.51,30.92 v37.79,28.64
N$11  (via drill 0.35)
  Top 0.305: LED2.3 24.08,48.77 15.54,40.23 10.87,40.23 v10.69,40.05 | v23.65,4.9 24.95,4.9 LED3.1
  Bottom 0.305: v23.65,4.9 23.57,4.97 15.87,4.97 10.69,10.16 v10.69,40.05
N$12  (via drill 0.35)
  Top 0.254: 37.79,26.55 37.4,26.16 37.14,26.16 R15.1
  Top 0.305: v37.79,26.61 37.79,26.55
  Bottom 0.254: J1.P$43 29.46,44.61 32.37,44.61 34.75,42.23 34.75,29.91 37.79,26.86 v37.79,26.61
N$13  (via drill 0.35)
  Top 0.254: LED4.3 77.72,2.8 77.73,2.79
  Top 0.406: 77.73,2.79 79.17,2.79 79.68,3.3 79.68,4.82 77.39,7.11 71.55,7.11 v68.76,4.31 | v36.24,4.31 36.24,8.73 JP3.3
  Bottom 0.406: v68.76,4.31 67.99,3.55 36.5,3.55 36.24,3.81 v36.24,4.31
N$14  (via drill 0.35)
  Top 0.254: v31.7,41.34 v31.71,41.33 34.14,41.33 34.95,42.14 R8.1
  Bottom 0.254: J1.P$39 31.65,41.38 v31.7,41.34
N$16  (via drill 0.35)
  Top 0.254: v32.97,42.61 32.97,43.42 33.88,44.33 R6.1
  Bottom 0.254: v32.97,42.61 32.54,42.18 J1.P$40
N$17  (via drill 0.35)
  Top 0.254: v31.93,43.68 31.93,44.95 33.45,46.48 34.91,46.48 R3.1
  Bottom 0.254: J1.P$41 31.49,43 31.93,43.43 v31.93,43.68
N$21
  Top 0.508: U1.6 17.91,14.15 18.26,14.51 18.87,14.51 C14.1
N$32  (via drill 0.35)
  Top 0.254: v37.79,30.92 37.54,30.67 36.62,30.67
  Top 0.305: R13.1 36.64,30.65 36.62,30.67
  Bottom 0.254: J1.P$45 33.22,46.2 36.22,43.2 36.22,33.72 37.79,32.14 v37.79,30.92
N$33  (via drill 0.35)
  Top 0.254: v37.79,33.46 37.29,32.96 37.08,32.96 R12.1
  Bottom 0.254: J1.P$46 33.76,47 37.13,43.62 37.13,34.23 37.79,33.57 v37.79,33.46
N$34  (via drill 0.35)
  Top 0.254: v37.79,35.5 37.34,35.5 R11.1
  Bottom 0.254: J1.P$47 34.49,47.8 37.79,44.5 v37.79,35.5
N$35  (via drill 0.35)
  Top 0.254: R7.1 36.7,37.02 38.05,37.02 v38.56,37.53
  Bottom 0.254: J1.P$48 35.04,48.6 38.56,45.09 v38.56,37.53
PILOTREAD  (via drill 0.35)
  Top 0.254: v74.09,41.91 74.34,41.65 85.77,41.65 87.55,39.87 87.55,38.67 U24.6
  Top 0.305: JP6.4 v70.79,54.61
  Bottom 0.254: v70.79,54.61 70.79,45.21 v74.09,41.91
RESET  (via drill 0.35)
  Top 0.254: U24.3 91.43,37.83 91.13,37.53 v91.13,34.99 | v26.11,40.58 21.79,36.26 v21.79,23.81 | v27.49,50.5 26.7,50.5 15.2,39 8.06,39 7.25,39.81 SW2.B v5.87,41.12 | v60.88,54.61 60.63,54.86 JP5.6
  Top 0.305: R2.1 88.06,42.92 | 88.06,42.92 88.06,42.16 89.33,40.89 91.11,40.89 91.43,40.57 U24.3 | 88.06,42.92 87.78,43.2 87.71,43.18 C9.2 | SW2.B' SW2.B
  Bottom 0.254: v91.13,34.99 64.69,34.99 | 64.69,34.99 51.21,34.99 | J1.P$38 v26.11,40.58 25.79,40.9 25.79,48.73 27.49,50.44 v27.49,50.5 | 64.69,34.99 60.88,38.8 v60.88,54.61 | P7.P$1 1.62,39.04 3.73,41.14 5.87,41.14 v5.87,41.12
  Bottom 0.3: v27.49,50.5 27.75,50.5 27.84,50.59 35.61,50.59 51.21,34.99
RXD1_5V  (via drill 0.35)
  Top 0.305: v38.78,48.76 38.78,51.77 JP2.4 | v58.34,37.08 58.34,29.97 71.55,16.76 D2.C
  Bottom 0.305: v38.78,48.76 39.04,48.51 41.53,48.51 50.67,39.37 56.06,39.37 v58.34,37.08
RXD_5V  (via drill 0.35)
  Top 0.152: v4.9,20.44 JP1.4 7.87,20.32
  Top 0.254: D3.C 75.75,11.43 62.15,11.43
  Top 0.305: v56.31,6.35 57.07,6.35 62.15,11.43 | v12.88,20.32 7.87,20.32 JP1.4
  Bottom 0.152: 4.85,20.42 4.86,20.41 v4.9,20.44
  Bottom 0.254: P5.P$1 4.85,20.42
  Bottom 0.305: v56.31,6.35 56.18,6.22 16.66,6.22 12.6,10.28 12.6,20.04 v12.88,20.32
SCL
  Top 0.254: QWIIC.4 54.69,6.61 61.28,13.2 84.25,13.2 87.62,16.58 U24.33
SDA
  Top 0.254: QWIIC.3 50.64,5.84 51.23,5.25 60.3,5.25 63.78,8.73 84.42,8.73 91.4,15.72 91.4,20.97 U24.36
TP_X+  (via drill 0.35)
  Top 0.254: U3.2 19.56,30.83 v19.77,31.03
  Bottom 0.254: J1.P$4 26.34,13.42 18.5,21.26 18.5,29.76 v19.77,31.03
TP_X-  (via drill 0.35)
  Top 0.254: v17.38,32.18 v17.38,32.16 18.3,31.25 U3.4
  Bottom 0.254: J1.P$2 26.32,11.81 16.78,21.36 16.78,31.58 v17.38,32.18
TP_Y+  (via drill 0.35)
  Top 0.254: v18.37,33.41 18.93,32.86 U3.3
  Bottom 0.254: J1.P$1 29.37,11.11 26.26,11.11 16.15,21.22 16.15,31.95 17.62,33.41 v18.37,33.41
TP_Y-  (via drill 0.35)
  Top 0.254: U3.5 17.66,30.69 v17.51,30.84
  Bottom 0.254: J1.P$3 26.38,12.62 17.76,21.24 17.76,30.59 v17.51,30.84
UART0_RXD0
  Top 0.254: 84.25,11.68 D3.A
  Top 0.305: U24.34 88.89,16.32 84.25,11.68
UART0_TXD0  (via drill 0.35)
  Top 0.152: 8.02,22.4 8.05,22.43
  Top 0.254: v4.9,22.42 8.65,22.42 8.66,22.43 | JP1.5 8.05,22.43
  Top 0.305: U24.35 90.16,16.07 83.74,9.65 61.9,9.65 58.92,6.67 v58.85,6.67 | v11.86,22.09 11.52,22.43 8.66,22.43 8.05,22.43
  Bottom 0.152: 4.93,22.45 v4.9,22.42
  Bottom 0.254: P6.P$1 1.65,22.48 4.9,22.48 4.93,22.45
  Bottom 0.305: v58.85,6.67 56.89,4.72 37.01,4.72 36.14,5.58 16.43,5.58 11.86,10.16 v11.86,22.09
VBUS  (via drill 0.35)
  Top 0.152: v3.49,18.47 4.81,18.47 4.85,18.43
  Top 0.406: JP1.3 4.85,18.43 4.06,19.22 4.06,24.71 28.12,48.76 35.99,48.76 36.75,49.53 36.75,51.8 JP2.3
  Top 0.508: U1.3 U1.2 14.18,13.09 C3.1 11.99,17.65 11.1,18.54 7.86,18.54 JP1.3
  Bottom 0.152: 3.4,18.44 3.43,18.41 v3.49,18.47
  Bottom 0.254: P4.P$1 3.4,18.44

### Text on the board
tNames: GND | BOOT | 3.3V | RXD | TXD | RESET | IO25 | IO32 | IO35 | IO34 | DEBUG | DEVOLOPMENT 3.3v MAX | GND | 5-12V | IO18 | RX | TX | IO19 | TX | + | RX | 5-12V | OpenEVSE WiFi TFT LCD v1.0.2 | - | GND | LED | GND | 3.3V | GND | 3.3V | SDA | SCL